# Altium schematic sheet Day.SchDoc
size A; SheetNumber: 1; SheetTotal: 1
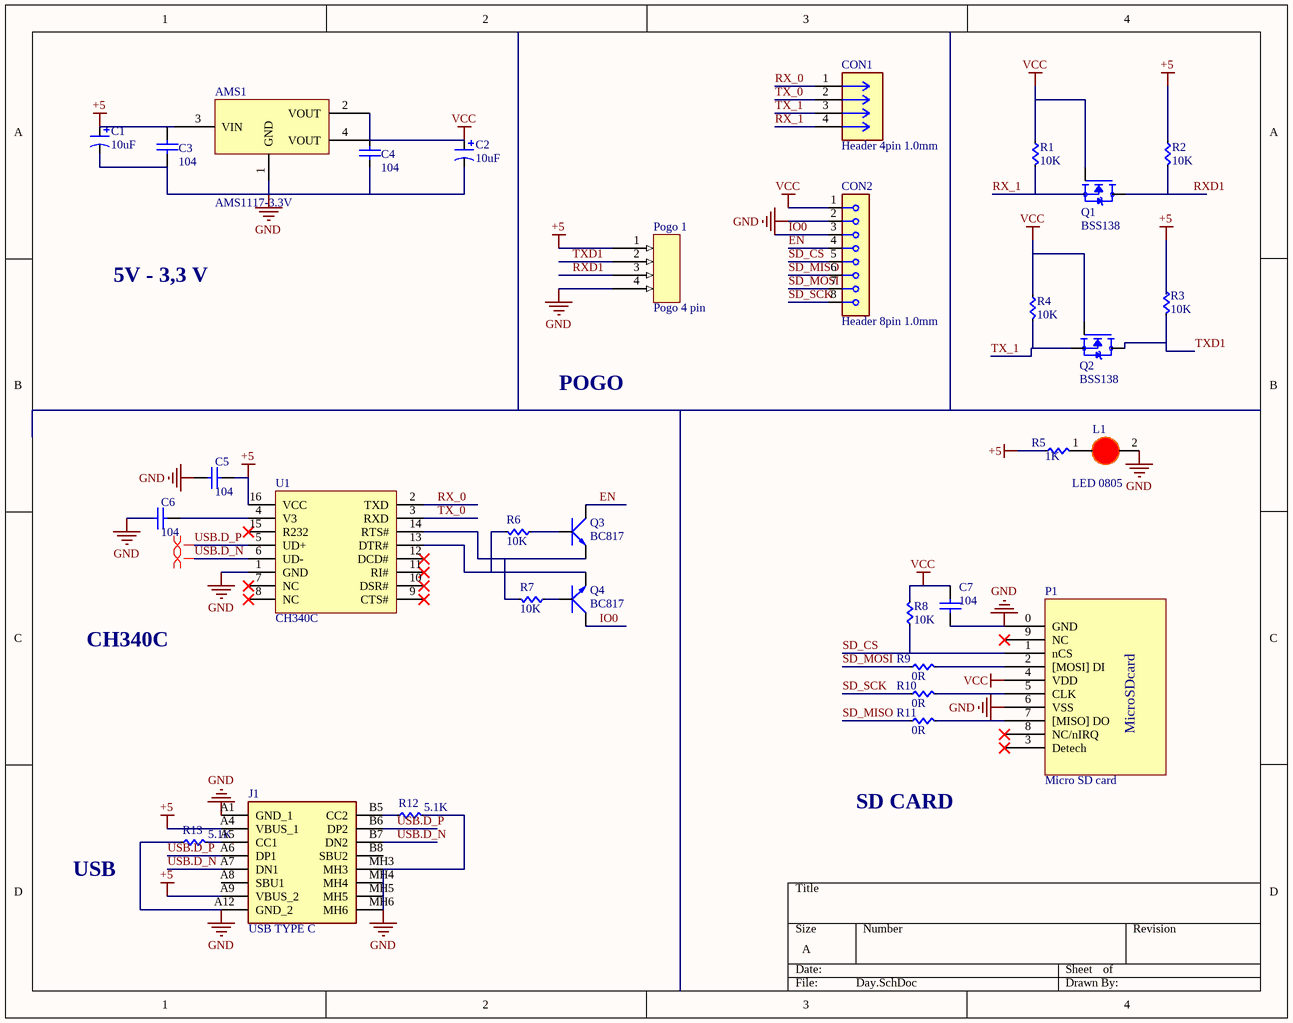
[diagram p0: Day.SchDoc]

## Parts
AMS1  AMS1117-3.3V  [SOT223_3]
C1  10uF  [CAP-ALUM-3054-TYPE-A]
C2  10uF  [CAP-ALUM-3054-TYPE-A]
C3  104  [tu 0805]
C4  104  [tu 0805]
C5  104  [tu 0805]
C6  104  [tu 0805]
C7  104  [tu 0805]
CON1  Header 4pin 1.0mm  [CONN4_BM04B-SRSS_JST - duplicate]
CON2  Header 8pin 1.0mm  [JST_BM08B-SRSS-TB(LF)(SN)]
J1  USB TYPE C  [USB type c CAM]
L1  LED 0805  [LED-0805-Red]
P1  Micro SD card  [MicroSD]
Pogo_1  Pogo 4 pin  [Pogo 4 pin]
Q1  BSS138  [SOT95P240X111-3N]
Q2  BSS138  [SOT95P240X111-3N]
Q3  BC817  [SOT-23]
Q4  BC817  [SOT-23]
R1  10K  [RES 0805]
R2  10K  [RES 0805]
R3  10K  [RES 0805]
R4  10K  [RES 0805]
R5  1K  [RES 0805]
R6  10K  [RES 0805]
R7  10K  [RES 0805]
R8  10K  [RES 0805]
R9  0R  [RES 0805]
R10  0R  [RES 0805]
R11  0R  [RES 0805]
R12  5.1K  [RES 0805]
R13  5.1K  [RES 0805]
U1  CH340C  [SOIC16_50_284_25X90_SMT]

## Nets
+5: AMS1.3(VIN) C1.1(Anode) C3.1 C5.1 J1.A4(VBUS_1) J1.A9(VBUS_2) Pogo_1.1 R2.1 R3.1 R5.1 U1.16(VCC)
GND: AMS1.1(GND) C1.2(Cathode) C2.2(Cathode) C3.2 C4.2 C5.2 C6.2 C7.2 CON2.2 J1.A1(GND_1) J1.A12(GND_2) J1.MH3 J1.MH4 J1.MH5 J1.MH6 L1.2(K) P1.0(GND) P1.6(VSS) Pogo_1.4 R12.2 R13.1 U1.1(GND)
VCC: AMS1.2(VOUT) AMS1.4(VOUT) C2.1(Anode) C4.1 C7.1 CON2.1 P1.4(VDD) Q1.1(G) Q2.1(G) R1.1 R4.1 R8.2
EN: CON2.4 Q3.3(C)
IO0: CON2.3 Q4.3(C)
RX_0: CON1.1 U1.2(TXD)
RX_1: CON1.4 Q1.2(S) R1.2
RXD1: Pogo_1.3 Q1.3(D) R2.2
SD_CS: CON2.5 P1.1(nCS) R8.1
SD_MISO: CON2.6 R11.1
SD_MOSI: CON2.7 R9.1
SD_SCK: CON2.8 R10.1
TX_0: CON1.2 U1.3(RXD)
TX_1: CON1.3 Q2.2(S) R4.2
TXD1: Pogo_1.2 Q2.3(D) R3.2
USB.D_N: J1.A7(DN1) J1.B7(DN2) U1.6(UD-)
USB.D_P: J1.A6(DP1) J1.B6(DP2) U1.5(UD+)
NetC6_1: C6.1 U1.4(V3)
NetJ1_A5: J1.A5(CC1) R13.2
NetJ1_B5: J1.B5(CC2) R12.1
NetL1_1: L1.1(A) R5.2
NetP1_2: P1.2([MOSI]_DI) R9.2
NetP1_5: P1.5(CLK) R10.2
NetP1_7: P1.7([MISO]_DO) R11.2
NetQ3_1: Q3.1(B) R6.1
NetQ3_2: Q3.2(E) R7.2 U1.14(RTS#)
NetQ4_1: Q4.1(B) R7.1
NetQ4_2: Q4.2(E) R6.2 U1.13(DTR#)

Not connected (* = marked no-connect by the designer): J1 A8(SBU1) B8(SBU2); P1 3(Detech)* 8(NC/nIRQ)* 9(NC)*; U1 7(NC)* 8(NC)* 9(CTS#)* 10(DSR#)* 11(RI#)* 12(DCD#)* 15(R232)*

## Layout directives
differential pair: USB.D_N, USB.D_P

## Notes on the sheet
- 5V - 3,3 V
- POGO
- CH340C
- SD CARD
- USB
- (in symbol Micro SD card) MicroSDcard

## Library data of the parts
AMS1 = AMS1117 SMD: Dán; Value: AMS1117-3.3V SOT223; Don_Vi: Con; Ma_Hang: MH000596; Ghi_Chu: *; Kieu_Chan: *; Chung_Loai: Dán
C1 C2 = CAP-ALUM-SMD: CASE-A-3216-18(mm) Aluminum Capacitors
C3-C7 = Tu 0805 104 50V 10%: Dán; Don_Vi: Con; So_Chan: 2; Ten_Linh_Kien: Tụ 0805 104-100nF 10% 50V; Ma_Hang: MH004551; Chung_Loai: Dán; Kieu_Chan: *
CON1 = Header 4pin 1.0mm: Connector Header Surface Mount, Right Angle 4 position 0.039 (1.00mm); MF: JST Sales; MP: SM04B-SRSS-TB; SnapEDA_Link: https://www.snapeda.com/parts/SM04B-SRSS-TB/JST/view-part/?ref=snap; Package: None; Value: *; Check_prices: https://www.snapeda.com/parts/SM04B-SRSS-TB/JST/view-part/?ref=eda
CON2 = Header 8pin 1.0mm: SH Series 8 Position 1 mm Pitch Surface Mount Side Entry Shrouded Header; MF: {'manufacturer': u'JST Sales America Inc.'}; MP: SM08B-SRSS-TB; Package: None; Price: None; Value: *; Availability: Unavailable
J1 = USB TYPE C: Connector; Manufacturer_Name: GCT (GLOBAL CONNECTOR TECHNOLOGY); Manufacturer_Part_Number: USB4800-03-A; Datasheet Link: https://gct.co/connector/usb4800; Height: 5.58mm; Mouser Part Number: 640-USB4800-03-A; Mouser Price/Stock: https://www.mouser.co.uk/ProductDetail/GCT/USB4800-03-A?qs=vvQtp7zwQdMkfG8vViEZoQ%3D%3D
L1 = LED 0805 Do: Dán; Don_Vi: Con; Ma_Hang: MH000897; Ten_Linh_Kien: LED 0805 Màu Đỏ (Red); Ghi_Chu: *; Kieu_Chan: *; Chung_Loai: Dán
Q1 Q2 = BSS138: N-Channel 50 V 220mA (Ta) 350mW (Ta) Surface Mount SOT-23-3; MF: onsemi; SnapEDA_Link: https://www.snapeda.com/parts/BSS138/Onsemi/view-part/?ref=snap; Package: SOT-23-3 ON Semiconductor; Value: *; MP: BSS138; Check_prices: https://www.snapeda.com/parts/BSS138/Onsemi/view-part/?ref=eda
Q3 Q4 = Trans BC817: SOT-23 - C8658; Value: C9014
R1-R4 R6-R8 = RES 0805: RES SMD 0805; Manufacturer: Vishay Dale; Manufacturer Part Number: CRCW040210K0FKED; Tolerance: ±1%; Power (Watts): 0.063W, 1/16W; Temperature Coefficient: ±100ppm/°C; Supplier 1: Digi-Key; RoHS: RoHS Compliant; Category: Resistors; Stock 1: 2392462; Pricing 1: 10=0.083, 50=0.0444, 200=0.0255, 1000=0.0174 (USD); Packaging: Cut Tape (CT); Resistance (Ohms): 10k; Composition: Thick Film; Features: Automotive AEC-Q200; Operating Temperature: -55°C ~ 155°C; Package / Case: 0402 (1005 Metric); Supplier Device Package: 0402 (1005 Metric); Size / Dimension: 0.039" L x 0.020" W (1.00mm x 0.50mm); Height: 0.016" (0.40mm); Number of Terminations: 2; ComponentLink1URL: http://www.vishay.com/docs/20035/dcrcwe3.pdf; ComponentLink1Description: http://www.vishay.com/docs/20035/dcrcwe3.pdf; Supplier Part Number 1: 541-10.0KLCT-ND
R5 R9-R13 = RES 0805: RES SMD 0805; Manufacturer: Vishay Dale; Manufacturer Part Number: CRCW040210K0FKED; Resistance (Ohms): 10k; Tolerance: ±1%; Power (Watts): 0.063W, 1/16W; Temperature Coefficient: ±100ppm/°C; Supplier 1: Digi-Key; RoHS: RoHS Compliant; Category: Resistors; Stock 1: 2392462; Pricing 1: 10=0.083, 50=0.0444, 200=0.0255, 1000=0.0174 (USD); Packaging: Cut Tape (CT); Composition: Thick Film; Features: Automotive AEC-Q200; Operating Temperature: -55°C ~ 155°C; Package / Case: 0402 (1005 Metric); Supplier Device Package: 0402 (1005 Metric); Size / Dimension: 0.039" L x 0.020" W (1.00mm x 0.50mm); Height: 0.016" (0.40mm); Number of Terminations: 2; ComponentLink1URL: http://www.vishay.com/docs/20035/dcrcwe3.pdf; ComponentLink1Description: http://www.vishay.com/docs/20035/dcrcwe3.pdf; Supplier Part Number 1: 541-10.0KLCT-ND
U1 = CH340C: USB Bridge, USB to UART USB 2.0 UART Interface; Manufacturer: Olimex; Alternate Part Number-1: NA; Manufacturer Part Number: CH340C; Case/Package: SOIC16; Supplier-1: LCSC; Supplier Part Number-1: C84681